# Altium project dual_adj_psu.PrjPcb
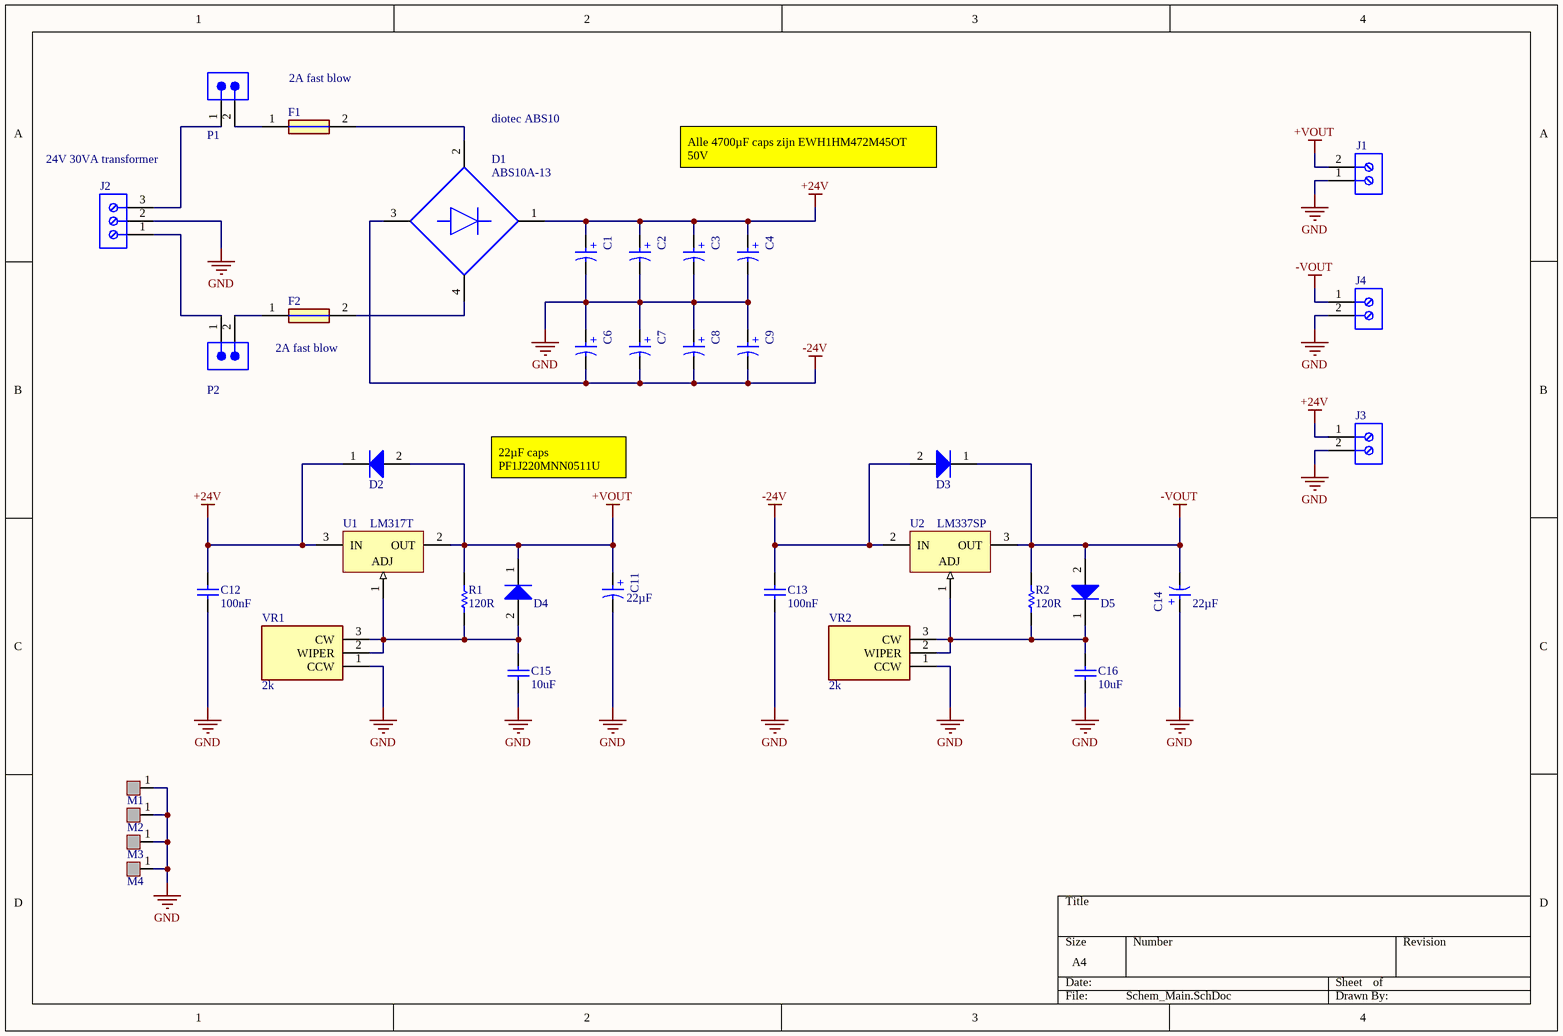
[diagram p0: Schem_Main.SchDoc]
1 sheet, 37 parts. Net scope: global (net labels, ports and power ports of the same name join across sheets).
Board file: PSU_main.PcbDoc

## Sheet Schem_Main.SchDoc
size A4; SheetNumber: 1; SheetTotal: 1

### Parts
C1  860010581025  [WCAP-ATG8_D18H35.5]  (value not drawn)
C2  860010581025  [WCAP-ATG8_D18H35.5]  (value not drawn)
C3  860010581025  [WCAP-ATG8_D18H35.5]  (value not drawn)
C4  860010581025  [WCAP-ATG8_D18H35.5]  (value not drawn)
C6  860010581025  [WCAP-ATG8_D18H35.5]  (value not drawn)
C7  860010581025  [WCAP-ATG8_D18H35.5]  (value not drawn)
C8  860010581025  [WCAP-ATG8_D18H35.5]  (value not drawn)
C9  860010581025  [WCAP-ATG8_D18H35.5]  (value not drawn)
C11  Capacitance: 22µF  [WCAP-ATG8_D5H11]  (hidden comment: 860010672010)
C12  value 100nF  [Wurth 0603 capacitor]  (hidden comment: Capacitor 100nF 0603 50V)
C13  value 100nF  [Wurth 0603 capacitor]  (hidden comment: Capacitor 100nF 0603 50V)
C14  Capacitance: 22µF  [WCAP-ATG8_D5H11]  (hidden comment: 860010672010)
C15  value 10uF  [Wurth 0805 capacitor]  (hidden comment: Capacitor 10uF 0805 50V)
C16  value 10uF  [Wurth 0805 capacitor]  (hidden comment: Capacitor 10uF 0805 50V)
D1  ABS10A-13  [FP-SOPA-4-MFG]
D2  RF071MM2STFTR  [Rohm SOD-123]  (value not drawn)
D3  RF071MM2STFTR  [Rohm SOD-123]  (value not drawn)
D4  RF071MM2STFTR  [Rohm SOD-123]  (value not drawn)
D5  RF071MM2STFTR  [Rohm SOD-123]  (value not drawn)
F1  3413.0219.22  [3413021922]  (value not drawn)
F2  3413.0219.22  [3413021922]  (value not drawn)
J1  691101710002  [Wurth 2 pin 5mm screw terminal]  (value not drawn)
J2  691101710003  [Wurth 3 pin 5mm screw terminal]  (value not drawn)
J3  691101710002  [Wurth 2 pin 5mm screw terminal]  (value not drawn)
J4  691101710002  [Wurth 2 pin 5mm screw terminal]  (value not drawn)
M1  Mounting hole  [M3 hole]  (value not drawn)
M2  Mounting hole  [M3 hole]  (value not drawn)
M3  Mounting hole  [M3 hole]  (value not drawn)
M4  Mounting hole  [M3 hole]  (value not drawn)
P1  61300211121  [2x1 2.54mm M]  (value not drawn)
P2  61300211121  [2x1 2.54mm M]  (value not drawn)
R1  value 120R  [Wurth 0603 Resistor]  (hidden comment: Resistor 120R 0603)
R2  value 120R  [Wurth 0603 Resistor]  (hidden comment: Resistor 120R 0603)
U1  LM317T  [TO-220]
U2  LM337SP  [TO220]
VR1  2k  [PDB181K215P503B]
VR2  2k  [PDB181K215P503B]

### Nets
+24V: C1.1(P) C2.1(P) C3.1(P) C4.1(P) C12.2 D1.1(+) D2.1(K) J3.1 U1.3(IN)
+VOUT: C11.1(P) D2.2(A) D4.1(K) J1.2 R1.2 U1.2(OUT)
-24V: C6.2(N) C7.2(N) C8.2(N) C9.2(N) C13.2 D1.3(-) D3.2(A) U2.2(IN)
-VOUT: C14.2(N) D3.1(K) D5.2(A) J4.1 R2.2 U2.3(OUT)
GND: C1.2(N) C2.2(N) C3.2(N) C4.2(N) C6.1(P) C7.1(P) C8.1(P) C9.1(P) C11.2(N) C12.1 C13.1 C14.1(P) C15.1 C16.1 J1.1 J2.2 J3.2 J4.2 M1.1 M2.1 M3.1 M4.1 VR1.1(CCW) VR2.1(CCW)
NetC15_2: C15.2 D4.2(A) R1.1 U1.1(ADJ) VR1.2(WIPER) VR1.3(CW)
NetC16_2: C16.2 D5.1(K) R2.1 U2.1(ADJ) VR2.2(WIPER) VR2.3(CW)
NetD1_2: D1.2(1_~) F1.2
NetD1_4: D1.4(2_~) F2.2
NetF1_1: F1.1 P1.2
NetF2_1: F2.1 P2.2
NetJ2_1: J2.1 P2.1
NetJ2_3: J2.3 P1.1

### Notes on the sheet
- 2A fast blow
- (near J2) 24V 30VA transformer
- (near D1) diotec ABS10
- Alle 4700µF caps zijn EWH1HM472M45OT
  50V
- 22µF caps PF1J220MNN0511U
- (in symbol CMP-03913-53914128-2) +
- (in symbol CMP-03913-54007253-2) +

### Library data of the parts
C1-C4 C6-C9 = CMP-03913-54007253-2: WCAP-ATG8 Aluminum Electrolytic Capacitors; Manufacturer Lifecycle Status: ACTIVE; Polarity: Polar; YEOL: 1 = Estimated lifetime > 10 years; Tolerance: 20%; Leakage Current: 1.645mA; Voltage Rating: 35V; Ripple Current: 2.86A; Capacitance: 4.7mF; Life (Hours): 2000hours; Pitch: 7.5mm; RoHS: Compliant; Lifecycle Status: Production; Diameter: 18mm; Mount: Through Hole; Lead Pitch: 7.493mm; Height - Seated (Max): 37.4904mm; Packaging: Tape & Box (TB); Length: 35.5mm; REACH SVHC: Unknown; Height: 35.5mm; Max Operating Temperature: 85°C; Voltage Rating (DC): 35V; Min Operating Temperature: -40°C; Case/Package: Radial
C11 C14 = CMP-03913-53914128-2: WCAP-ATG8 Aluminum Electrolytic Capacitors; Voltage Rating: 50V; Ripple Current: 110mA; Leakage Current: 11µA; Dissipation Factor: 10%; Life (Hours): 2000hours; Polarity: Polar; Material: Aluminium; Tolerance: 20%; Pitch: 2mm; REACH SVHC: Unknown; Length: 11mm; Mount: Through Hole; Case/Package: Radial; Height - Seated (Max): 12.4968mm; Lead Pitch: 2.0066mm; RoHS: Compliant; Diameter: 5mm; Min Operating Temperature: -40°C; Height: 12.5mm; Voltage Rating (DC): 50V; Max Operating Temperature: 85°C; Packaging: Tape & Box (TB)
D1 = CMP-12791-000054-1: BRIDGE RECT 1PHASE 1KV 1A 4SOPA; Min Operating Temperature: -55°C; Max Operating Temperature: 150°C; Case/Package: SMD/SMT; Average Rectified Current: 1A; Mount: Surface Mount; Packaging: Cut Tape
D2-D5 = Diode RF071MM2STFTR
F1 F2 = 3413.0219.22: Fuse; Manufacturer_Name: SCHURTER; Datasheet Link: https://www.schurter.com/en/datasheet/typ_USI_1206.pdf; Height: 0.6mm; Manufacturer_Part_Number: 3413.0219.22; Mouser Part Number: 693-3413.0219.22; Mouser Price/Stock: https://www.mouser.com/Search/Refine.aspx?Keyword=693-3413.0219.22
J1 J3 J4 = 2 pin 5mm screw terminal: WR-TBL Series 101 Horizontal Entry Modular, THT, pitch 5mm, 02p; Manufacturer: Wurth Elektronik; Modularity: Yes; Rated Current: 16A; Wire Section: 26 to 14 (AWG) 0.5 to 2.5 (mm^2); Working Voltage: 250V (AC); Manufacturer Part Number: 691101710002; Product Series: WR-TBL; ComponentLink1Description: Website Link; ComponentLink1URL: https://www.we-online.com; ComponentLink2Description: Datasheet Link; ComponentLink2URL: https://www.we-online.com/components/products/datasheet/691101710002; Mount: Through Hole; Operating Temperature Min: -40degC; Operating Temperature Max: 105degC; Packaging: Box; Application: Pressure Clamp; Number of Pins: 2; Number of Rows: 1; Orientation: Horizontal; Lead Pitch: 5mm
J2 = 3 pin 5mm screw terminal: WR-TBL Series 101 Horizontal Entry Modular, THT, pitch 5mm, 03p; Manufacturer: Wurth Elektronik; Modularity: Yes; Rated Current: 16A; Wire Section: 26 to 14 (AWG) 0.5 to 2.5 (mm^2); Working Voltage: 250V (AC); Manufacturer Part Number: 691101710003; Product Series: WR-TBL; ComponentLink1Description: Website Link; ComponentLink1URL: https://www.we-online.com; ComponentLink2Description: Datasheet Link; ComponentLink2URL: https://www.we-online.com/components/products/datasheet/691101710003; Mount: Through Hole; Operating Temperature Min: -40degC; Operating Temperature Max: 105degC; Packaging: Box; Application: Pressure Clamp; Number of Pins: 3; Number of Rows: 1; Orientation: Horizontal; Lead Pitch: 5mm
P1 P2 = 2P: WR-PHD Pin Header, THT, Vertical, pitch 2.54mm, 1 Row, 2P; Manufacturer: Wurth Elektronik; Contact Resistance: 20mOhm; Rated Current: 3A; Working Voltage: 250V; Withstanding Voltage: 500V; Manufacturer Part Number: 61300211121; Category: Board-to-Board Connectors; Match Code: WR-PHD; ComponentLink1Description: Website Link; ComponentLink1URL: https://www.we-online.com/redexpert/article/61300211121?ad; ComponentLink2Description: Datasheet Link; ComponentLink2URL: https://www.we-online.com/redexpert/spec/61300211121?ad; Mount: Through Hole; Operating Temperature Max: 105°C; Operating Temperature Min: -40°C; Packaging: Bag; Gender: Pin Header; Number of Pins: 2; Number of Rows: 1; Orientation: Vertical; Pitch: 2.54mm
U1 = CMP-0244-00444-1: 1.5A, 1.2V to 37V Adjustable Voltage Regulator, 3-Pin TO-220; PackageVersion: 2011; ComponentLink1URL: http://www.st.com; ComponentLink2URL: http://www.st.com/internet/com/TECHNICAL_RESOURCES/TECHNICAL_LITERATURE/DATASHEET/CD00000455.pdf; PackageDescription: TO, Thru-Hole, Vertical, Heatsink Mounted; 3 In-Line Leads; Pitch 2.54 mm; PackageReference: TO-220; ComponentLink1Description: Manufacturer URL; ComponentLink3URL: http://www.st.com/internet/com/TECHNICAL_RESOURCES/TECHNICAL_LITERATURE/PACKAGE_INFORMATION/CD00004649.pdf; DatasheetVersion: 1/11/2011; ComponentLink2Description: Datasheet; ComponentLink3Description: Package Specification
U2 = CMP-0244-00420-1: Three-Terminal Negative Voltage Regulator, 3-Pin TO-220; PackageReference: TO220; DatasheetVersion: 1/10/2011; ComponentLink3Description: Package Specification; ComponentLink3URL: http://www.st.com/internet/com/TECHNICAL_RESOURCES/TECHNICAL_LITERATURE/PACKAGE_INFORMATION/CD00004649.pdf; PackageDescription: TO, Thru-Hole, Vertical, Heatsink Mounted; 3 In-Line Leads; Pitch 2.54 mm; PackageVersion: ver3.0; ComponentLink1Description: Manufacturer URL; ComponentLink1URL: http://www.st.com; ComponentLink2Description: Datasheet; ComponentLink2URL: http://www.st.com/internet/com/TECHNICAL_RESOURCES/TECHNICAL_LITERATURE/DATASHEET/CD00000468.pdf
VR1 VR2 = PDB181-K215P-503B: Variable Resistor; Manufacturer_Name: Bourns; Datasheet Link: https://www.digikey.in/en/products/detail/bourns-inc/PDB181-K215P-503B/4699117; Height: 21mm; Manufacturer_Part_Number: PDB181-K215P-503B; Mouser Part Number: 652-PDB181K215P503B; Mouser Price/Stock: https://www.mouser.co.uk/ProductDetail/Bourns/PDB181-K215P-503B?qs=Zq5ylnUbLm4zTjfFsN3naw%3D%3D

## Assembly variants
Original: not fitted M1 M2 M3 M4